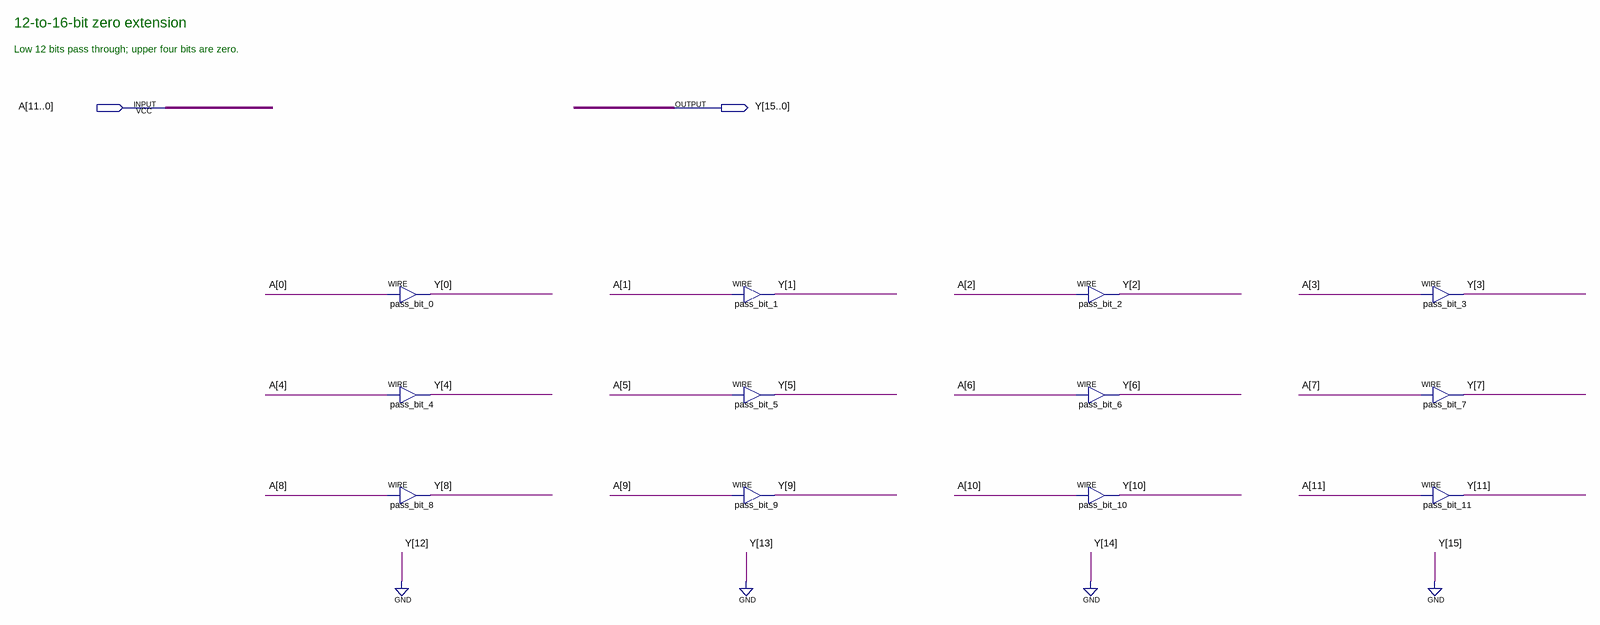
[diagram p0: schematic sheet]
// Quartus schematic zext12.bdf as structural Verilog: 12 symbols, 2 pins
module zext12 (
  input  [11:0] A,
  output [15:0] Y
);

  assign Y[0] = A[0];  // WIRE pass_bit_0
  assign Y[4] = A[4];  // WIRE pass_bit_4
  assign Y[8] = A[8];  // WIRE pass_bit_8
  assign Y[1] = A[1];  // WIRE pass_bit_1
  assign Y[5] = A[5];  // WIRE pass_bit_5
  assign Y[9] = A[9];  // WIRE pass_bit_9
  assign Y[2] = A[2];  // WIRE pass_bit_2
  assign Y[6] = A[6];  // WIRE pass_bit_6
  assign Y[10] = A[10];  // WIRE pass_bit_10
  assign Y[3] = A[3];  // WIRE pass_bit_3
  assign Y[7] = A[7];  // WIRE pass_bit_7
  assign Y[11] = A[11];  // WIRE pass_bit_11

  assign Y[15:12] = 4'b0000;

  // Notes on the sheet:
  //   12-to-16-bit zero extension
  //   Low 12 bits pass through; upper four bits are zero.
endmodule
